# Altium project TIE_2025.PrjPcb
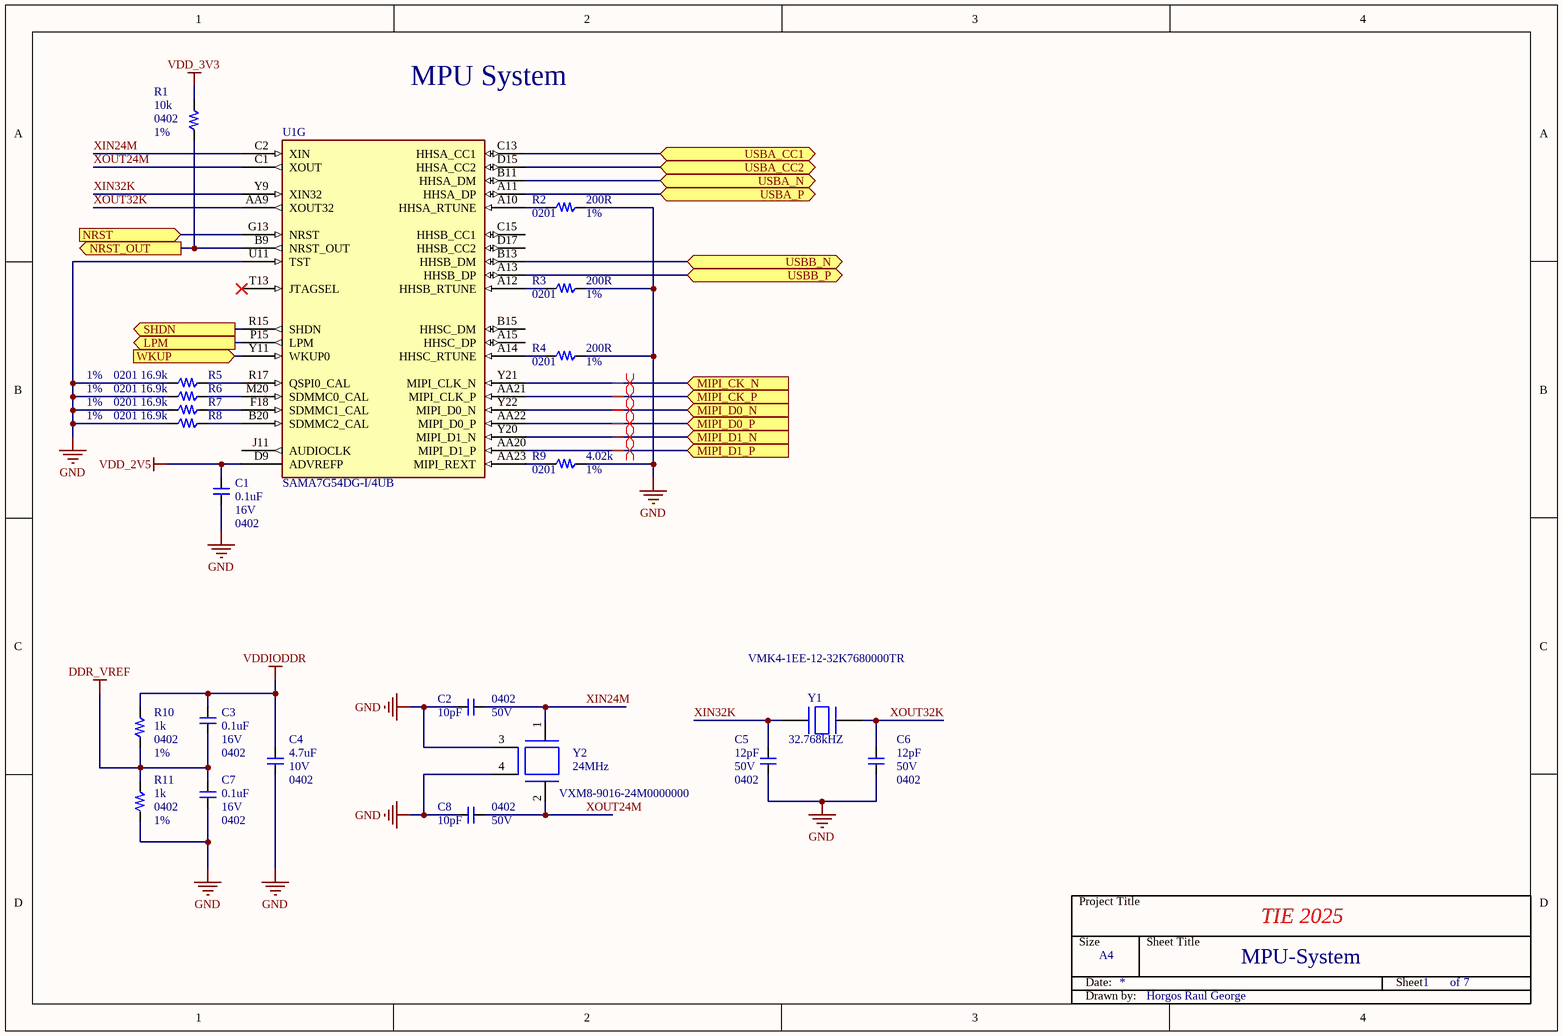
[diagram p0: MPU-System.SchDoc]
7 sheets, 139 parts. Net scope: flat (ports and power ports of the same name join across sheets).
Board file: PCB1.PcbDoc
Sheets:
  MPU-System.SchDoc
  MPU-Power.SchDoc
  MPU-PIO.SchDoc
  USB.SchDoc
  PMIC.SchDoc
  SDCard-MIPI-User.SchDoc
  Ethernet.SchDoc

## Sheet MPU-System.SchDoc
size A4; SheetNumber: 1; SheetTotal: 7

### Parts
C1  0.1uF  Rated Voltage: 16V  Package: 0402  [CAP0402]
C2  10pF  Rated Voltage: 50V  Package: 0402  [CAP0402]
C3  0.1uF  Rated Voltage: 16V  Package: 0402  [CAP0402]
C4  4.7uF  Package: 0402  Rated Voltage: 10V  [CAP0402]
C5  12pF  Rated Voltage: 50V  Package: 0402  [CAP0402]
C6  12pF  Rated Voltage: 50V  Package: 0402  [CAP0402]
C7  0.1uF  Rated Voltage: 16V  Package: 0402  [CAP0402]
C8  10pF  Rated Voltage: 50V  Package: 0402  [CAP0402]
R1  10k  Tolerance: 1%  Package: 0402  [RES0402]
R2  200R  Tolerance: 1%  Package: 0201  [RES0201]
R3  200R  Tolerance: 1%  Package: 0201  [RES0201]
R4  200R  Tolerance: 1%  Package: 0201  [RES0201]
R5  16.9k  Tolerance: 1%  Package: 0201  [RES0201]
R6  16.9k  Tolerance: 1%  Package: 0201  [RES0201]
R7  16.9k  Tolerance: 1%  Package: 0201  [RES0201]
R8  16.9k  Tolerance: 1%  Package: 0201  [RES0201]
R9  4.02k  Package: 0201  Tolerance: 1%  [RES0201]
R10  1k  Tolerance: 1%  Package: 0402  [RES0402]
R11  1k  Tolerance: 1%  Package: 0402  [RES0402]
Title_1  Title Block  (value not drawn)  (graphical)
U1  SAMA7G54DG-I/4UB  [BGA427C80P25X21_2100X1800X120]  (part G of 8)
Y1  32.768kHZ  [VMK4-1EE-12-32K7680000TR]
Y2  24MHz  [VXM8-9016-24M0000000]

### Ports
LPM (out, see PMIC[1A]), MIPI_CK_N (in, see SDCard-MIPI-User[1A]), MIPI_CK_P (in, see SDCard-MIPI-User[1B]), MIPI_D0_N (in, see SDCard-MIPI-User[1A]), MIPI_D0_P (in, see SDCard-MIPI-User[1A]), MIPI_D1_N (in, see SDCard-MIPI-User[1A]), MIPI_D1_P (in, see SDCard-MIPI-User[1A]), NRST (in, see PMIC[1B], SDCard-MIPI-User[2D]), NRST_OUT (out, see Ethernet[1D]), SHDN (out, see PMIC[1A]), USBA_CC1 (bidir, see USB[2A]), USBA_CC2 (bidir, see USB[2B]), USBA_N (bidir, see USB[2A]), USBA_P (bidir, see USB[2A]), USBB_N (bidir, see USB[2D]), USBB_P (bidir, see USB[2D]), WKUP (in, see PMIC[1B])

### Nets
DDR_VREF: C3.1 C7.2 R10.1 R11.2
GND: C1.1 C2.1 C4.1 C5.1 C6.1 C7.1 C8.1 R2.2 R3.2 R4.2 R5.1 R6.1 R7.1 R8.1 R9.2 R11.1 U1.U11(TST) Y2.3 Y2.4
VDD_2V5: C1.2 U1.D9(ADVREFP)
VDD_3V3: R1.2
VDDIODDR: C3.2 C4.2 R10.2
LPM: U1.P15(LPM) ; port LPM
MIPI_CK_N: U1.Y21(MIPI_CLK_N) ; port MIPI_CK_N
MIPI_CK_P: U1.AA21(MIPI_CLK_P) ; port MIPI_CK_P
MIPI_D0_N: U1.Y22(MIPI_D0_N) ; port MIPI_D0_N
MIPI_D0_P: U1.AA22(MIPI_D0_P) ; port MIPI_D0_P
MIPI_D1_N: U1.Y20(MIPI_D1_N) ; port MIPI_D1_N
MIPI_D1_P: U1.AA20(MIPI_D1_P) ; port MIPI_D1_P
NRST: U1.G13(NRST) ; port NRST
NRST_OUT: R1.1 U1.B9(NRST_OUT) ; port NRST_OUT
SHDN: U1.R15(SHDN) ; port SHDN
USBA_CC1: U1.C13(HHSA_CC1) ; port USBA_CC1
USBA_CC2: U1.D15(HHSA_CC2) ; port USBA_CC2
USBA_N: U1.B11(HHSA_DM) ; port USBA_N
USBA_P: U1.A11(HHSA_DP) ; port USBA_P
USBB_N: U1.B13(HHSB_DM) ; port USBB_N
USBB_P: U1.A13(HHSB_DP) ; port USBB_P
WKUP: U1.Y11(WKUP0) ; port WKUP
XIN24M: C2.2 U1.C2(XIN) Y2.1
XIN32K: C5.2 U1.Y9(XIN32) Y1.1
XOUT24M: C8.2 U1.C1(XOUT) Y2.2
XOUT32K: C6.2 U1.AA9(XOUT32) Y1.2
NetR2_1: R2.1 U1.A10(HHSA_RTUNE)
NetR3_1: R3.1 U1.A12(HHSB_RTUNE)
NetR4_1: R4.1 U1.A14(HHSC_RTUNE)
NetR5_2: R5.2 U1.R17(QSPI0_CAL)
NetR6_2: R6.2 U1.M20(SDMMC0_CAL)
NetR7_2: R7.2 U1.F18(SDMMC1_CAL)
NetR8_2: R8.2 U1.B20(SDMMC2_CAL)
NetR9_1: R9.1 U1.AA23(MIPI_REXT)

Not connected (* = marked no-connect by the designer): U1 A15(HHSC_DP) B15(HHSC_DM) C15(HHSB_CC1) D17(HHSB_CC2) J11(AUDIOCLK) T13(JTAGSEL)*

### Layout directives
differential pair: MIPI_CK_N, MIPI_CK_P, MIPI_D0_N, MIPI_D0_P, MIPI_D1_N, MIPI_D1_P

### Notes on the sheet
- MPU System
- MPU-System
- (in symbol Title Block) Project Title; TIE 2025; Size; Sheet Title; A4; Date:; Sheet; of; Drawn by:; Horgos Raul George

### Library data of the parts
C1 C3 C7 = C0402C104K4RAC7867: CAP CER 0.1uF 16V 10% X7R SMD 0402; Manufacturer: KEMET; .Checked_PCB: AI; Manufacturer Part Number: C0402C104K4RAC7867; .Checked_SCH: AI; .Creator: AI
C2 C8 = QSCF500Q100J1GV001T: CAP CER 10pF 50V 5% C0G/NP0 SMD 0402; Manufacturer: Johanson Technology; .Checked_PCB: AI; Manufacturer Part Number: QSCF500Q100J1GV001T; .Checked_SCH: AI; .Creator: AI
C4 = C1005X5R1A475K050BC: CAP CER 4.7uF 10V 10% X5R SMD 0402; Manufacturer: TDK Corporation; .Checked_PCB: AI; Manufacturer Part Number: C1005X5R1A475K050BC; .Checked_SCH: AI; .Creator: AI
C5 C6 = QSCF500Q120J1GV001T: CAP CER 12pF 50V 5% C0G/NP0 SMD 0402; Manufacturer: Johanson Technology; .Checked_PCB: AI; Manufacturer Part Number: QSCF500Q120J1GV001T; .Checked_SCH: AI; .Creator: AI
R1 = ERJ-2RKF1002X: RES TKF 10k 1% 1/10W SMD 0402; Manufacturer: Panasonic; Manufacturer Part Number: ERJ-2RKF1002X
R2-R4 = CR0201-FW-2000GLF: RES TKF 200R 1% 1/20W SMD 0201; Manufacturer: Bourns Inc.; Manufacturer Part Number: CR0201-FW-2000GLF
R5-R8 = ERJ-1GNF1692C: RES TKF 16.9k 1% 1/20W SMD 0201; Manufacturer: Panasonic Electronic; Manufacturer Part Number: ERJ-1GNF1692C
R9 = RC0201FR-074K02L: RES TKF 4.02k 1% 1/20W SMD 0201; Manufacturer: Yageo; Manufacturer Part Number: RC0201FR-074K02L
R10 R11 = ERJ-2RKF1001X: RES TKF 1k 1% 1/10W SMD 0402; Manufacturer: Panasonic; Manufacturer Part Number: ERJ-2RKF1001X
U1 = SAMA7G54DG-I/4UB: MCHP MPU SiP 32-BIT Cortex-A7 1000MHz 128kB 2Gbit / SAMA7G54D2G-I/4UB LFBGA-427; Manufacturer: Microchip Technology; Manufacturer Part Number: SAMA7G54DG-I/4UB
Y1 = VMK4-1EE-12-32K7680000TR: MCHP CRYSTAL 32.768kHz 12.5pF VMK4-1EE-12-32K7680000TR / SMD L2.0W1.2H0.5; Manufacturer: Microchip Technology; Manufacturer Part Number: VMK4-1EE-12-32K7680000TR
Y2 = VXM8-9016-24M0000000: MCHP CRYSTAL 24MHz 10pF VXM8-9016-24M000000 SMD / L2.5W2H0.55; Manufacturer: Microchip Technology; Manufacturer Part Number: VXM8-9016-24M0000000

## Sheet MPU-Power.SchDoc
size A4; SheetNumber: 2; SheetTotal: 7
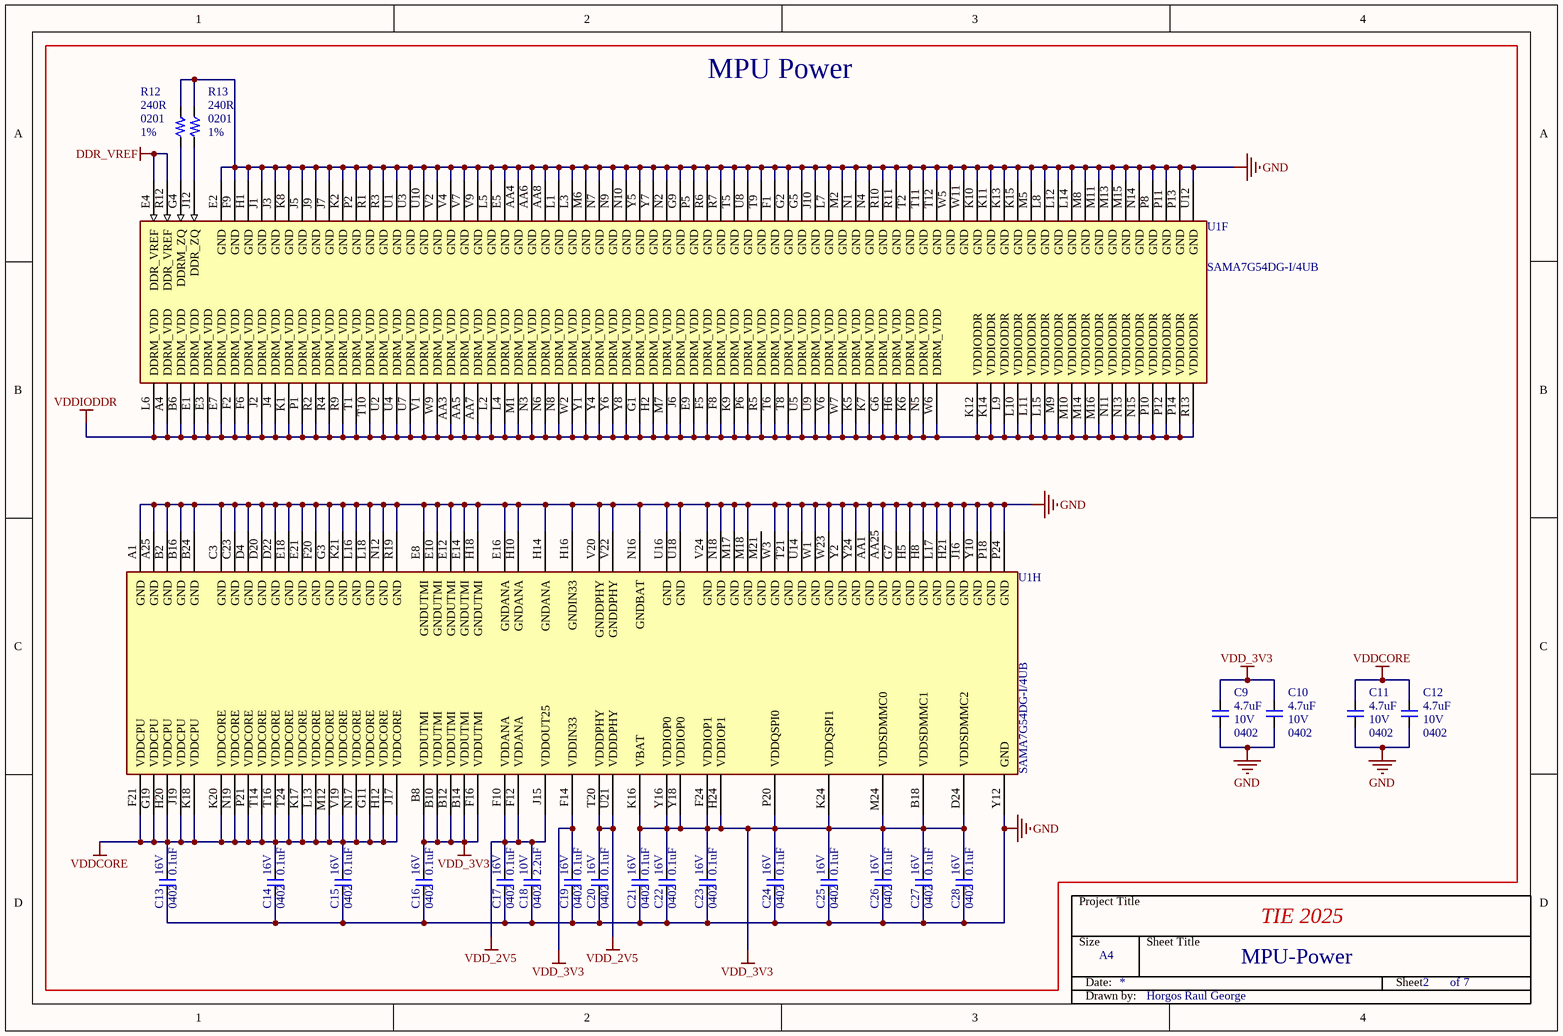
[diagram p1: MPU-Power.SchDoc]

### Parts
C9  4.7uF  Package: 0402  Rated Voltage: 10V  [CAP0402]
C10  4.7uF  Package: 0402  Rated Voltage: 10V  [CAP0402]
C11  4.7uF  Package: 0402  Rated Voltage: 10V  [CAP0402]
C12  4.7uF  Package: 0402  Rated Voltage: 10V  [CAP0402]
C13  0.1uF  Rated Voltage: 16V  Package: 0402  [CAP0402]
C14  0.1uF  Rated Voltage: 16V  Package: 0402  [CAP0402]
C15  0.1uF  Rated Voltage: 16V  Package: 0402  [CAP0402]
C16  0.1uF  Rated Voltage: 16V  Package: 0402  [CAP0402]
C17  0.1uF  Rated Voltage: 16V  Package: 0402  [CAP0402]
C18  2.2uF  Package: 0402  Rated Voltage: 10V  [CAP0402]
C19  0.1uF  Rated Voltage: 16V  Package: 0402  [CAP0402]
C20  0.1uF  Rated Voltage: 16V  Package: 0402  [CAP0402]
C21  0.1uF  Rated Voltage: 16V  Package: 0402  [CAP0402]
C22  0.1uF  Rated Voltage: 16V  Package: 0402  [CAP0402]
C23  0.1uF  Rated Voltage: 16V  Package: 0402  [CAP0402]
C24  0.1uF  Rated Voltage: 16V  Package: 0402  [CAP0402]
C25  0.1uF  Rated Voltage: 16V  Package: 0402  [CAP0402]
C26  0.1uF  Rated Voltage: 16V  Package: 0402  [CAP0402]
C27  0.1uF  Rated Voltage: 16V  Package: 0402  [CAP0402]
C28  0.1uF  Rated Voltage: 16V  Package: 0402  [CAP0402]
R12  240R  Package: 0201  Tolerance: 1%  [RES0201]
R13  240R  Package: 0201  Tolerance: 1%  [RES0201]
Title_2  Title Block  (value not drawn)  (graphical)
U1  SAMA7G54DG-I/4UB  [BGA427C80P25X21_2100X1800X120]  (parts F,H of 8)

### Nets
DDR_VREF: U1.E4(DDR_VREF) U1.R12(DDR_VREF)
GND: C9.1 C10.1 C11.1 C12.1 C13.1 C14.1 C15.1 C16.1 C17.1 C18.1 C19.1 C20.1 C21.1 C22.1 C23.1 C24.1 C25.1 C26.1 C27.1 C28.1 R12.2 R13.1 U1.A1(GND) U1.A25(GND) U1.AA1(GND) U1.AA4(GND) U1.AA6(GND) U1.AA8(GND) U1.AA25(GND) U1.B2(GND) U1.B16(GND) U1.B24(GND) U1.C3(GND) U1.C23(GND) U1.D4(GND) U1.D20(GND) U1.D22(GND) U1.E2(GND) U1.E5(GND) U1.E8(GNDUTMI) U1.E10(GNDUTMI) U1.E12(GNDUTMI) U1.E14(GNDUTMI) U1.E16(GNDANA) U1.E18(GND) U1.E21(GND) U1.F1(GND) U1.F9(GND) U1.F20(GND) U1.G2(GND) U1.G3(GND) U1.G5(GND) U1.G7(GND) U1.G9(GND) U1.H1(GND) U1.H5(GND) U1.H8(GND) U1.H10(GNDANA) U1.H14(GNDANA) U1.H16(GNDIN33) U1.H18(GNDUTMI) U1.H21(GND) U1.J1(GND) U1.J3(GND) U1.J5(GND) U1.J7(GND) U1.J9(GND) U1.J10(GND) U1.J16(GND) U1.K2(GND) U1.K8(GND) U1.K10(GND) U1.K11(GND) U1.K13(GND) U1.K15(GND) U1.K21(GND) U1.L1(GND) U1.L3(GND) U1.L5(GND) U1.L7(GND) U1.L8(GND) U1.L12(GND) U1.L14(GND) U1.L16(GND) U1.L17(GND) U1.L18(GND) U1.M2(GND) U1.M5(GND) U1.M6(GND) U1.M8(GND) U1.M11(GND) U1.M13(GND) U1.M15(GND) U1.M17(GND) U1.M18(GND) U1.N1(GND) U1.N2(GND) U1.N4(GND) U1.N7(GND) U1.N9(GND) U1.N10(GND) U1.N12(GND) U1.N14(GND) U1.N16(GNDBAT) U1.N18(GND) U1.P2(GND) U1.P5(GND) U1.P8(GND) U1.P11(GND) U1.P13(GND) U1.P18(GND) U1.P24(GND) U1.R1(GND) U1.R3(GND) U1.R6(GND) U1.R7(GND) U1.R10(GND) U1.R11(GND) U1.R19(GND) U1.T2(GND) U1.T5(GND) U1.T9(GND) U1.T11(GND) U1.T12(GND) U1.T21(GND) U1.U1(GND) U1.U3(GND) U1.U8(GND) U1.U10(GND) U1.U12(GND) U1.U14(GND) U1.U16(GND) U1.U18(GND) U1.V2(GND) U1.V4(GND) U1.V7(GND) U1.V9(GND) U1.V20(GNDDPHY) U1.V22(GNDDPHY) U1.V24(GND) U1.W1(GND) U1.W3(GND) U1.W5(GND) U1.W11(GND) U1.W23(GND) U1.Y2(GND) U1.Y5(GND) U1.Y7(GND) U1.Y10(GND) U1.Y12(GND) U1.Y24(GND)
VDD_2V5: C17.2 C18.2 C20.2 U1.F10(VDDANA) U1.F12(VDDANA) U1.J15(VDDOUT25) U1.T20(VDDDPHY) U1.U21(VDDDPHY)
VDD_3V3: C9.2 C10.2 C16.2 C19.2 C21.2 C22.2 C23.2 C24.2 C25.2 C26.2 C27.2 C28.2 U1.B8(VDDUTMI) U1.B10(VDDUTMI) U1.B12(VDDUTMI) U1.B14(VDDUTMI) U1.B18(VDDSDMMC1) U1.D24(VDDSDMMC2) U1.F14(VDDIN33) U1.F16(VDDUTMI) U1.F24(VDDIOP1) U1.H24(VDDIOP1) U1.K16(VBAT) U1.K24(VDDQSPI1) U1.M24(VDDSDMMC0) U1.P20(VDDQSPI0) U1.Y16(VDDIOP0) U1.Y18(VDDIOP0)
VDDCORE: C11.2 C12.2 C13.2 C14.2 C15.2 U1.F21(VDDCPU) U1.G11(VDDCORE) U1.G19(VDDCPU) U1.H12(VDDCORE) U1.H20(VDDCPU) U1.J17(VDDCORE) U1.J19(VDDCPU) U1.K17(VDDCORE) U1.K18(VDDCPU) U1.K20(VDDCORE) U1.L13(VDDCORE) U1.M12(VDDCORE) U1.N17(VDDCORE) U1.N19(VDDCORE) U1.P21(VDDCORE) U1.T14(VDDCORE) U1.T16(VDDCORE) U1.T24(VDDCORE) U1.V19(VDDCORE)
VDDIODDR: U1.A4(DDRM_VDD) U1.AA3(DDRM_VDD) U1.AA5(DDRM_VDD) U1.AA7(DDRM_VDD) U1.B6(DDRM_VDD) U1.E1(DDRM_VDD) U1.E3(DDRM_VDD) U1.E7(DDRM_VDD) U1.E9(DDRM_VDD) U1.F2(DDRM_VDD) U1.F5(DDRM_VDD) U1.F6(DDRM_VDD) U1.F8(DDRM_VDD) U1.G1(DDRM_VDD) U1.G6(DDRM_VDD) U1.H2(DDRM_VDD) U1.H6(DDRM_VDD) U1.J2(DDRM_VDD) U1.J4(DDRM_VDD) U1.J6(DDRM_VDD) U1.K1(DDRM_VDD) U1.K5(DDRM_VDD) U1.K6(DDRM_VDD) U1.K7(DDRM_VDD) U1.K9(DDRM_VDD) U1.K12(VDDIODDR) U1.K14(VDDIODDR) U1.L2(DDRM_VDD) U1.L4(DDRM_VDD) U1.L6(DDRM_VDD) U1.L9(VDDIODDR) U1.L10(VDDIODDR) U1.L11(VDDIODDR) U1.L15(VDDIODDR) U1.M1(DDRM_VDD) U1.M7(DDRM_VDD) U1.M9(VDDIODDR) U1.M10(VDDIODDR) U1.M14(VDDIODDR) U1.M16(VDDIODDR) U1.N3(DDRM_VDD) U1.N5(DDRM_VDD) U1.N6(DDRM_VDD) U1.N8(DDRM_VDD) U1.N11(VDDIODDR) U1.N13(VDDIODDR) U1.N15(VDDIODDR) U1.P1(DDRM_VDD) U1.P6(DDRM_VDD) U1.P10(VDDIODDR) U1.P12(VDDIODDR) U1.P14(VDDIODDR) U1.R2(DDRM_VDD) U1.R4(DDRM_VDD) U1.R5(DDRM_VDD) U1.R9(DDRM_VDD) U1.R13(VDDIODDR) U1.T1(DDRM_VDD) U1.T6(DDRM_VDD) U1.T8(DDRM_VDD) U1.T10(DDRM_VDD) U1.U2(DDRM_VDD) U1.U4(DDRM_VDD) U1.U5(DDRM_VDD) U1.U7(DDRM_VDD) U1.U9(DDRM_VDD) U1.V1(DDRM_VDD) U1.V6(DDRM_VDD) U1.W2(DDRM_VDD) U1.W6(DDRM_VDD) U1.W7(DDRM_VDD) U1.W9(DDRM_VDD) U1.Y1(DDRM_VDD) U1.Y4(DDRM_VDD) U1.Y6(DDRM_VDD) U1.Y8(DDRM_VDD)
NetR12_1: R12.1 U1.G4(DDRM_ZQ)
NetR13_2: R13.2 U1.J12(DDR_ZQ)

Not connected (* = marked no-connect by the designer): U1 M21(GND)

### Notes on the sheet
- MPU Power
- MPU-Power
- (in symbol Title Block) Project Title; TIE 2025; Size; Sheet Title; A4; Date:; Sheet; of; Drawn by:; Horgos Raul George

### Library data of the parts
C9-C12 = C1005X5R1A475K050BC: as C4 on sheet MPU-System; Manufacturer Part Number: C1005X5R1A475K050BC; .Checked_SCH: AI; .Creator: AI
C13-C17 C19-C28 = C0402C104K4RAC7867: as C1 on sheet MPU-System; Manufacturer Part Number: C0402C104K4RAC7867; .Checked_SCH: AI; .Creator: AI
C18 = GRM155C71A225KE11J: CAP CER 2.2uF 10V 10% X7S SMD 0402; Manufacturer: Murata; .Checked_PCB: AI; Manufacturer Part Number: GRM155C71A225KE11J; .Checked_SCH: AI; .Creator: AI
R12 R13 = RC0201FR-07240RL: RES TKF 240R 1% 1/20W SMD 0201; Manufacturer: Yageo; Manufacturer Part Number: RC0201FR-07240RL
U1 = SAMA7G54DG-I/4UB: as U1 on sheet MPU-System; Manufacturer Part Number: SAMA7G54DG-I/4UB

## Sheet MPU-PIO.SchDoc
size A4; SheetNumber: 3; SheetTotal: 7
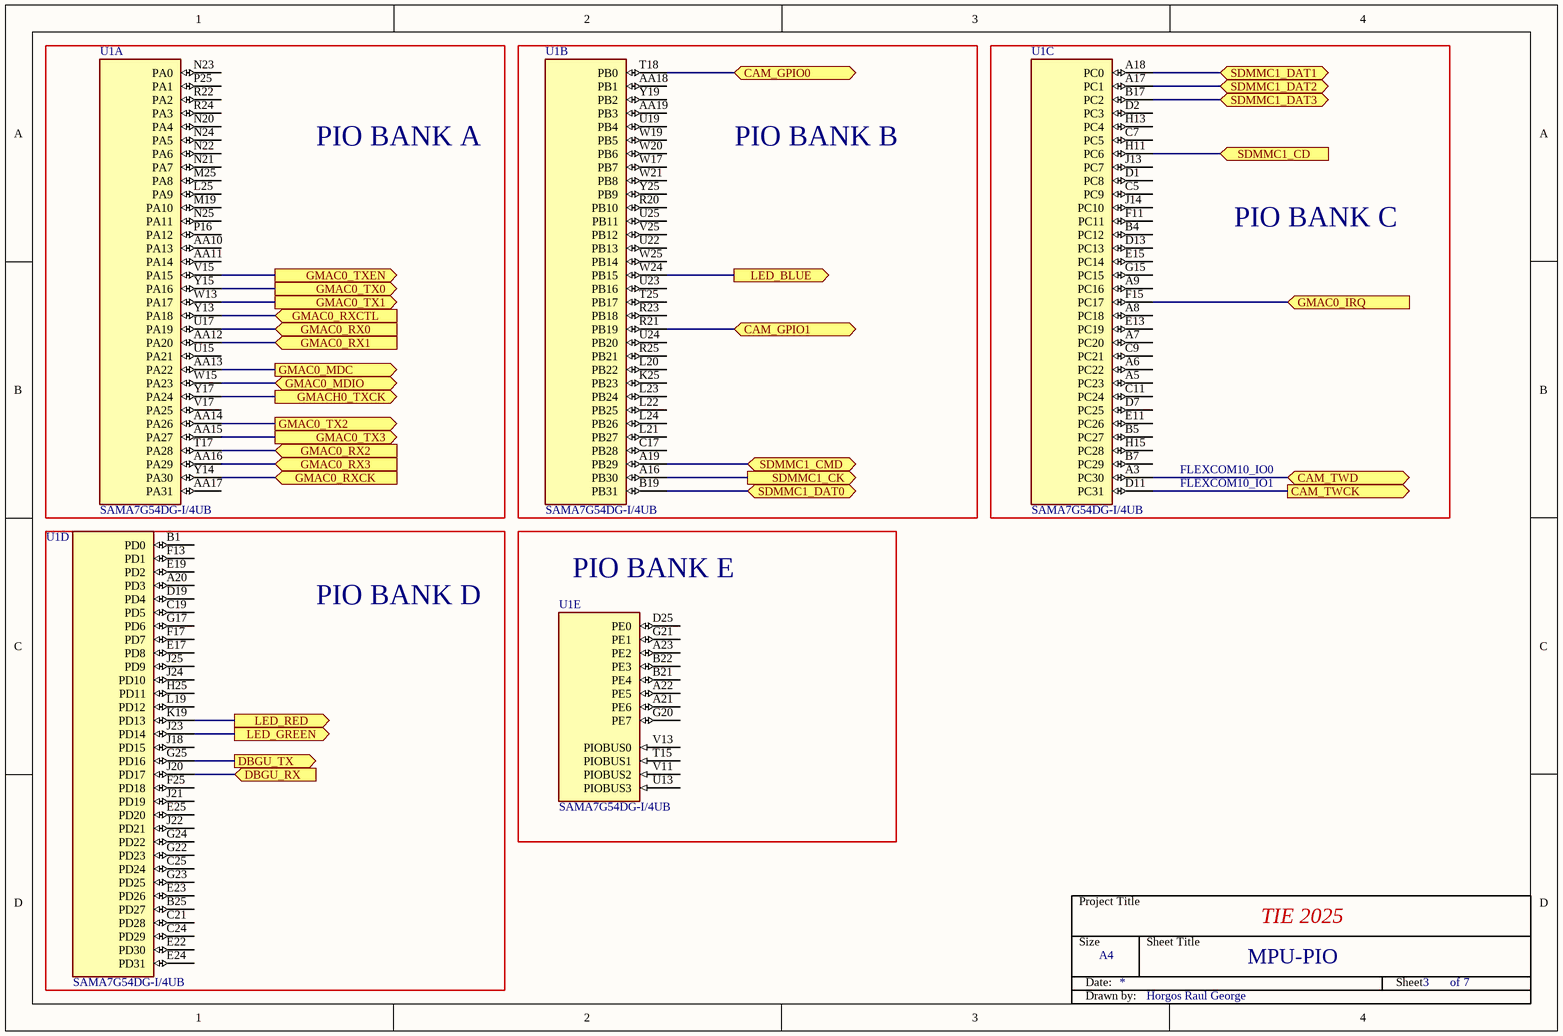
[diagram p2: MPU-PIO.SchDoc]

### Parts
Title_3  Title Block  (value not drawn)  (graphical)
U1  SAMA7G54DG-I/4UB  [BGA427C80P25X21_2100X1800X120]  (parts A,B,C,D,E of 8)

### Blocks framed on the sheet
PIO BANK A: U1
PIO BANK B: U1
PIO BANK C: U1
PIO BANK D: U1
PIO BANK E: U1

### Ports
CAM_GPIO0 (bidir, see SDCard-MIPI-User[1B]), CAM_GPIO1 (bidir, see SDCard-MIPI-User[1B]), CAM_TWCK (out, see SDCard-MIPI-User[1B]), CAM_TWD (bidir, see SDCard-MIPI-User[1B]), DBGU_RX (in, see SDCard-MIPI-User[2D]), DBGU_TX (out, see SDCard-MIPI-User[2D]), GMAC0_IRQ (in, see Ethernet[1C]), GMAC0_MDC (out, see Ethernet[1C]), GMAC0_MDIO (bidir, see Ethernet[1C]), GMAC0_RX0 (in, see Ethernet[1C]), GMAC0_RX1 (in, see Ethernet[1C]), GMAC0_RX2 (in, see Ethernet[1C]), GMAC0_RX3 (in, see Ethernet[1C]), GMAC0_RXCK (in, see Ethernet[1C]), GMAC0_RXCTL (in, see Ethernet[1C]), GMAC0_TX0 (out, see Ethernet[1C]), GMAC0_TX1 (out, see Ethernet[1C]), GMAC0_TX2 (out, see Ethernet[1C]), GMAC0_TX3 (out, see Ethernet[1C]), GMAC0_TXEN (out, see Ethernet[1C]), GMACH0_TXCK (out, see Ethernet[1C]), LED_BLUE (out, see SDCard-MIPI-User[1C]), LED_GREEN (out, see SDCard-MIPI-User[1C]), LED_RED (out, see SDCard-MIPI-User[1C]), SDMMC1_CD (in, see SDCard-MIPI-User[2B]), SDMMC1_CK (out, see SDCard-MIPI-User[2B]), SDMMC1_CMD (bidir, see SDCard-MIPI-User[2B]), SDMMC1_DAT0 (bidir, see SDCard-MIPI-User[2A]), SDMMC1_DAT1 (bidir, see SDCard-MIPI-User[2A]), SDMMC1_DAT2 (bidir, see SDCard-MIPI-User[2A]), SDMMC1_DAT3 (bidir, see SDCard-MIPI-User[2A])

### Nets
CAM_GPIO0: U1.T18(PB0) ; port CAM_GPIO0
CAM_GPIO1: U1.R21(PB19) ; port CAM_GPIO1
CAM_TWCK: U1.D11(PC31) ; port CAM_TWCK
CAM_TWD: U1.A3(PC30) ; port CAM_TWD
DBGU_RX: U1.J20(PD17) ; port DBGU_RX
DBGU_TX: U1.G25(PD16) ; port DBGU_TX
GMAC0_IRQ: U1.F15(PC17) ; port GMAC0_IRQ
GMAC0_MDC: U1.AA13(PA22) ; port GMAC0_MDC
GMAC0_MDIO: U1.W15(PA23) ; port GMAC0_MDIO
GMAC0_RX0: U1.U17(PA19) ; port GMAC0_RX0
GMAC0_RX1: U1.AA12(PA20) ; port GMAC0_RX1
GMAC0_RX2: U1.T17(PA28) ; port GMAC0_RX2
GMAC0_RX3: U1.AA16(PA29) ; port GMAC0_RX3
GMAC0_RXCK: U1.Y14(PA30) ; port GMAC0_RXCK
GMAC0_RXCTL: U1.Y13(PA18) ; port GMAC0_RXCTL
GMAC0_TX0: U1.Y15(PA16) ; port GMAC0_TX0
GMAC0_TX1: U1.W13(PA17) ; port GMAC0_TX1
GMAC0_TX2: U1.AA14(PA26) ; port GMAC0_TX2
GMAC0_TX3: U1.AA15(PA27) ; port GMAC0_TX3
GMAC0_TXEN: U1.V15(PA15) ; port GMAC0_TXEN
GMACH0_TXCK: U1.Y17(PA24) ; port GMACH0_TXCK
LED_BLUE: U1.W24(PB15) ; port LED_BLUE
LED_GREEN: U1.J23(PD14) ; port LED_GREEN
LED_RED: U1.K19(PD13) ; port LED_RED
SDMMC1_CD: U1.H11(PC6) ; port SDMMC1_CD
SDMMC1_CK: U1.A16(PB30) ; port SDMMC1_CK
SDMMC1_CMD: U1.A19(PB29) ; port SDMMC1_CMD
SDMMC1_DAT0: U1.B19(PB31) ; port SDMMC1_DAT0
SDMMC1_DAT1: U1.A18(PC0) ; port SDMMC1_DAT1
SDMMC1_DAT2: U1.A17(PC1) ; port SDMMC1_DAT2
SDMMC1_DAT3: U1.B17(PC2) ; port SDMMC1_DAT3

Not connected (* = marked no-connect by the designer): U1 A5(PC23) A6(PC22) A7(PC20) A8(PC18) A9(PC16) A20(PD3) A21(PE6) A22(PE5) A23(PE2) AA10(PA13) AA11(PA14) AA17(PA31) AA18(PB1) AA19(PB3) B1(PD0) B4(PC12) B5(PC27) B7(PC29) B21(PE4) B22(PE3) B25(PD27) C5(PC9) C7(PC5) C9(PC21) C11(PC24) C17(PB28) C19(PD5) C21(PD28) C24(PD29) C25(PD24) D1(PC8) D2(PC3) D7(PC25) D13(PC13) D19(PD4) D25(PE0) E11(PC26) E13(PC19) E15(PC14) E17(PD8) E19(PD2) E22(PD30) E23(PD26) E24(PD31) E25(PD20) F11(PC11) F13(PD1) F17(PD7) F25(PD18) G15(PC15) G17(PD6) G20(PE7) G21(PE1) G22(PD23) G23(PD25) G24(PD22) H13(PC4) H15(PC28) H25(PD11) J13(PC7) J14(PC10) J18(PD15) J21(PD19) J22(PD21) J24(PD10) J25(PD9) K25(PB23) L19(PD12) L20(PB22) L21(PB27) L22(PB25) L23(PB24) L24(PB26) L25(PA9) M19(PA10) M25(PA8) N20(PA4) N21(PA7) N22(PA6) N23(PA0) N24(PA5) N25(PA11) P16(PA12) P25(PA1) R20(PB10) R22(PA2) R23(PB18) R24(PA3) R25(PB21) T15(PIOBUS1) T25(PB17) U13(PIOBUS3) U15(PA21) U19(PB4) U22(PB13) U23(PB16) U24(PB20) U25(PB11) V11(PIOBUS2) V13(PIOBUS0) V17(PA25) V25(PB12) W17(PB7) W19(PB5) W20(PB6) W21(PB8) W25(PB14) Y19(PB2) Y25(PB9)

### Notes on the sheet
- FLEXCOM10_IO0
- FLEXCOM10_IO1
- MPU-PIO
- (in symbol Title Block) Project Title; TIE 2025; Size; Sheet Title; A4; Date:; Sheet; of; Drawn by:; Horgos Raul George

### Library data of the parts
U1 = SAMA7G54DG-I/4UB: as U1 on sheet MPU-System; Manufacturer Part Number: SAMA7G54DG-I/4UB

## Sheet USB.SchDoc
size A4; SheetNumber: 4; SheetTotal: 7
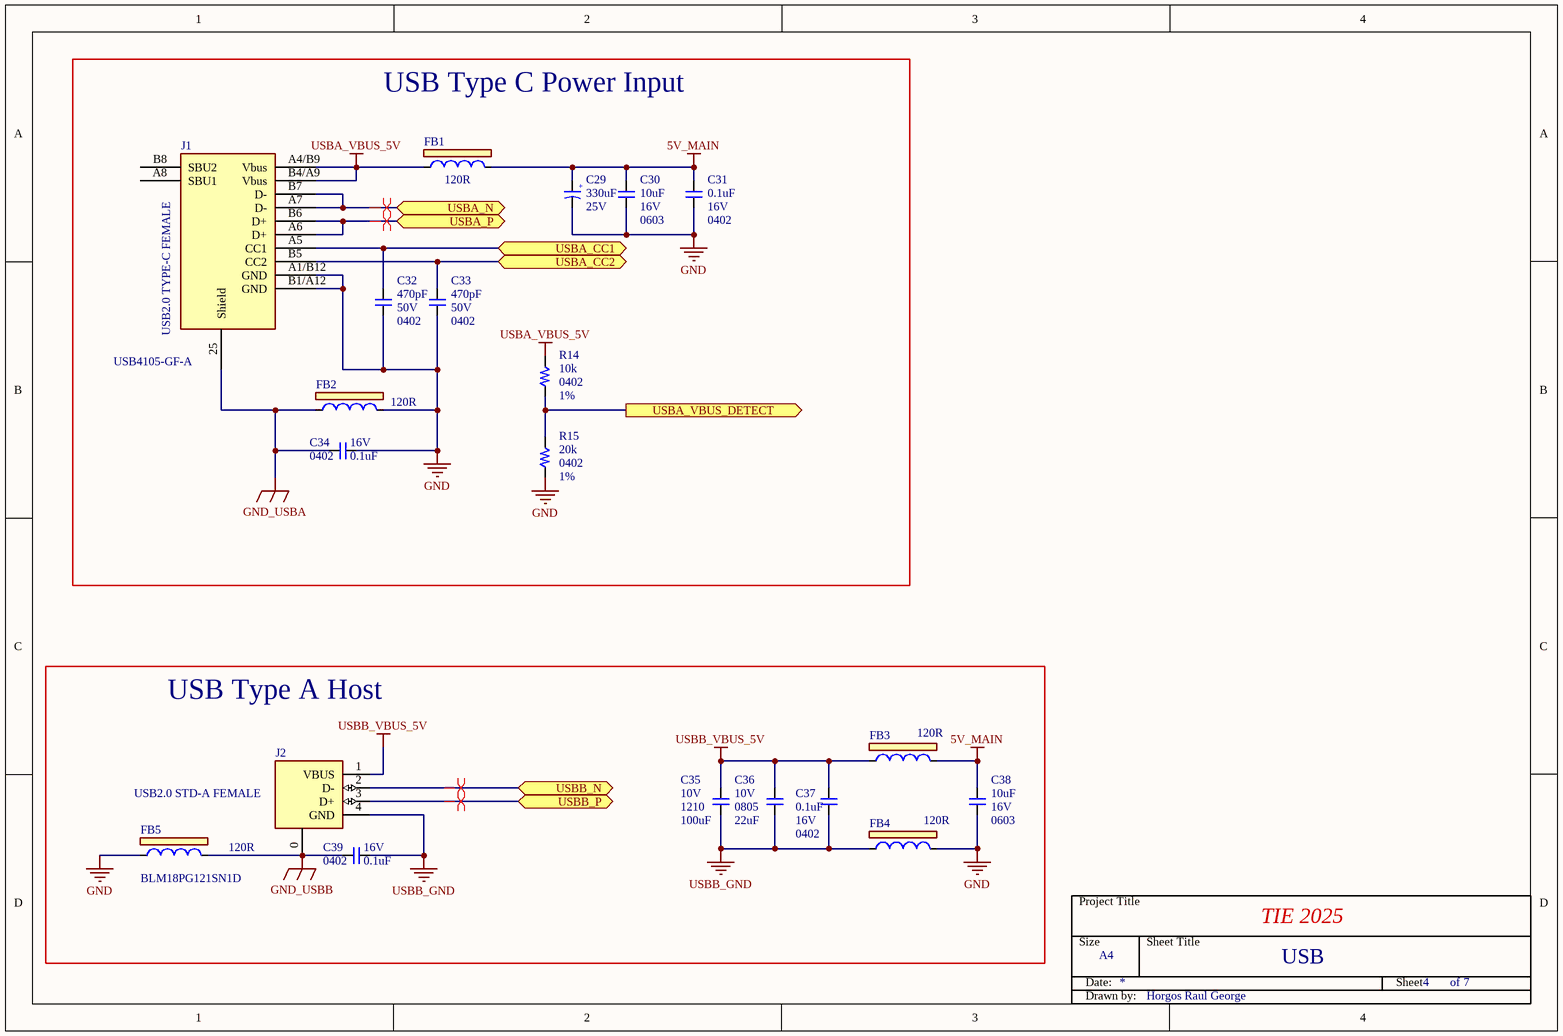
[diagram p3: USB.SchDoc]

### Parts
C29  330uF  Rated Voltage: 25V  [CAP ALU]
C30  10uF  Rated Voltage: 16V  Pacakage: 0603  [CAP0603]
C31  0.1uF  Rated Voltage: 16V  Package: 0402  [CAP0402]
C32  470pF  Rated Voltage: 50V  Package: 0402  [CAP0402]
C33  470pF  Rated Voltage: 50V  Package: 0402  [CAP0402]
C34  0.1uF  Rated Voltage: 16V  Package: 0402  [CAP0402]
C35  100uF  Rated Voltage: 10V  Package: 1210  [CAP1210]
C36  22uF  Rated Voltage: 10V  Package: 0805  [CAP0805]
C37  0.1uF  Rated Voltage: 16V  Package: 0402  [CAP0402]
C38  10uF  Rated Voltage: 16V  Pacakage: 0603  [CAP0603]
C39  0.1uF  Rated Voltage: 16V  Package: 0402  [CAP0402]
FB1  120R  [FB0603]
FB2  120R  [FB0603]
FB3  120R  [FB0603]
FB4  120R  [FB0603]
FB5  120R  [FB0603]
J1  USB2.0 TYPE-C FEMALE  [USB4105-GF-A]
J2  USB2.0 STD-A FEMALE  [292303-1]
R14  10k  Tolerance: 1%  Package: 0402  [RES0402]
R15  20k  Tolerance: 1%  Package: 0402  [RES0402]
Title_4  Title Block  (value not drawn)  (graphical)

### Blocks framed on the sheet
USB Type C Power Input: C29-C34 FB1 FB2 J1 R14 R15
USB Type A Host: C35-C39 FB3-FB5 J2

### Ports
USBA_CC1 (bidir, see MPU-System[2A]), USBA_CC2 (bidir, see MPU-System[2A]), USBA_N (bidir, see MPU-System[2A]), USBA_P (bidir, see MPU-System[2A]), USBA_VBUS_DETECT (out), USBB_N (bidir, see MPU-System[2B]), USBB_P (bidir, see MPU-System[2B])

### Nets
5V_MAIN: C29.1 C30.2 C31.2 C38.2 FB1.2 FB3.2
GND: C29.2 C30.1 C31.1 C32.1 C33.1 C34.1 C38.1 FB2.2 FB4.2 FB5.1 J1.A1/B12(GND) J1.B1/A12(GND) R15.1
GND_USBA: C34.2 FB2.1 J1.25(Shield)
GND_USBB: C39.2 FB5.2 J2.0
USBA_VBUS_5V: FB1.1 J1.A4/B9(Vbus) J1.B4/A9(Vbus) R14.2
USBB_GND: C35.1 C36.1 C37.1 C39.1 FB4.1 J2.4(GND)
USBB_VBUS_5V: C35.2 C36.2 C37.2 FB3.1 J2.1(VBUS)
USBA_CC1: C32.2 J1.A5(CC1) ; port USBA_CC1
USBA_CC2: C33.2 J1.B5(CC2) ; port USBA_CC2
USBA_N: J1.A7(D-) J1.B7(D-) ; port USBA_N
USBA_P: J1.A6(D+) J1.B6(D+) ; port USBA_P
USBA_VBUS_DETECT: R14.1 R15.2 ; port USBA_VBUS_DETECT
USBB_N: J2.2(D-) ; port USBB_N
USBB_P: J2.3(D+) ; port USBB_P

Not connected (* = marked no-connect by the designer): J1 A8(SBU1) B8(SBU2)

### Layout directives
differential pair: USBA_N, USBA_P, USBB_N, USBB_P

### Notes on the sheet
- USB
- (in symbol Title Block) Project Title; TIE 2025; Size; Sheet Title; A4; Date:; Sheet; of; Drawn by:; Horgos Raul George
- (in symbol UWT1E331MNL1GS) +

### Library data of the parts
C29 = UWT1E331MNL1GS: CAP ALU 330uF 25V 20% SMD F; Manufacturer: Nichicon; Manufacturer Part Number: UWT1E331MNL1GS
C30 C38 = GRT188R61C106KE13D: CAP CER 10uF 16V 10% X5R SMD 0603 AEC-Q200; Manufacturer: Murata; .Checked_PCB: IC; Manufacturer Part Number: GRT188R61C106KE13D; .Checked_SCH: IC; .Creator: IC
C31 C34 C37 C39 = C0402C104K4RAC7867: as C1 on sheet MPU-System; Manufacturer Part Number: C0402C104K4RAC7867; .Checked_SCH: AI; .Creator: AI
C32 C33 = GRM1555C1H471JA01D: CAP CER 470pF 50V 5% NP0 SMD 0402; Manufacturer: Murata; .Checked_PCB: AI; Manufacturer Part Number: GRM1555C1H471JA01D; .Checked_SCH: AI; .Creator: AI
C35 = GRM32ER61A107ME20L: CAP CER 100uF 10V 20% X5R SMD 1210; Manufacturer: Murata Electronics North; .Checked_PCB: IC; Manufacturer Part Number: GRM32ER61A107ME20L; .Checked_SCH: IC
C36 = C2012X7S1A226M125AC: CAP CER 22uF 10V 20% X7S SMD 0805; Manufacturer: TDK Corporation; Manufacturer Part Number: C2012X7S1A226M125AC
FB1-FB5 = BLM18PG121SN1D: FERRITE BEAD 120 OHM 0603 1LN; Manufacturer: Murata; .Checked_PCB: AI; .Checked_SCH: AI; .Creator: AI
  FB5: Manufacturer Part Number: BLM18PG121SN1D
J1 = USB4105-GF-A: CONN USB2.0 TYPE-C Female SMD/TH R/A; Manufacturer: GCT; Manufacturer Part Number: USB4105-GF-A
J2 = 292303-1: CON USB2.0 STD-A FEMALE TH R/A; Manufacturer: TE Connectivity AMP; Manufacturer Part Number: 292303-1
R14 = ERJ-2RKF1002X: as R1 on sheet MPU-System; Manufacturer Part Number: ERJ-2RKF1002X
R15 = RMCF0402FT20K0: RES TKF 20k 1% 1/10W SMD 0402; Manufacturer: Stackpole Electronics Inc; Manufacturer Part Number: RMCF0402FT20K0

## Sheet PMIC.SchDoc
size A4; SheetNumber: 5; SheetTotal: 7
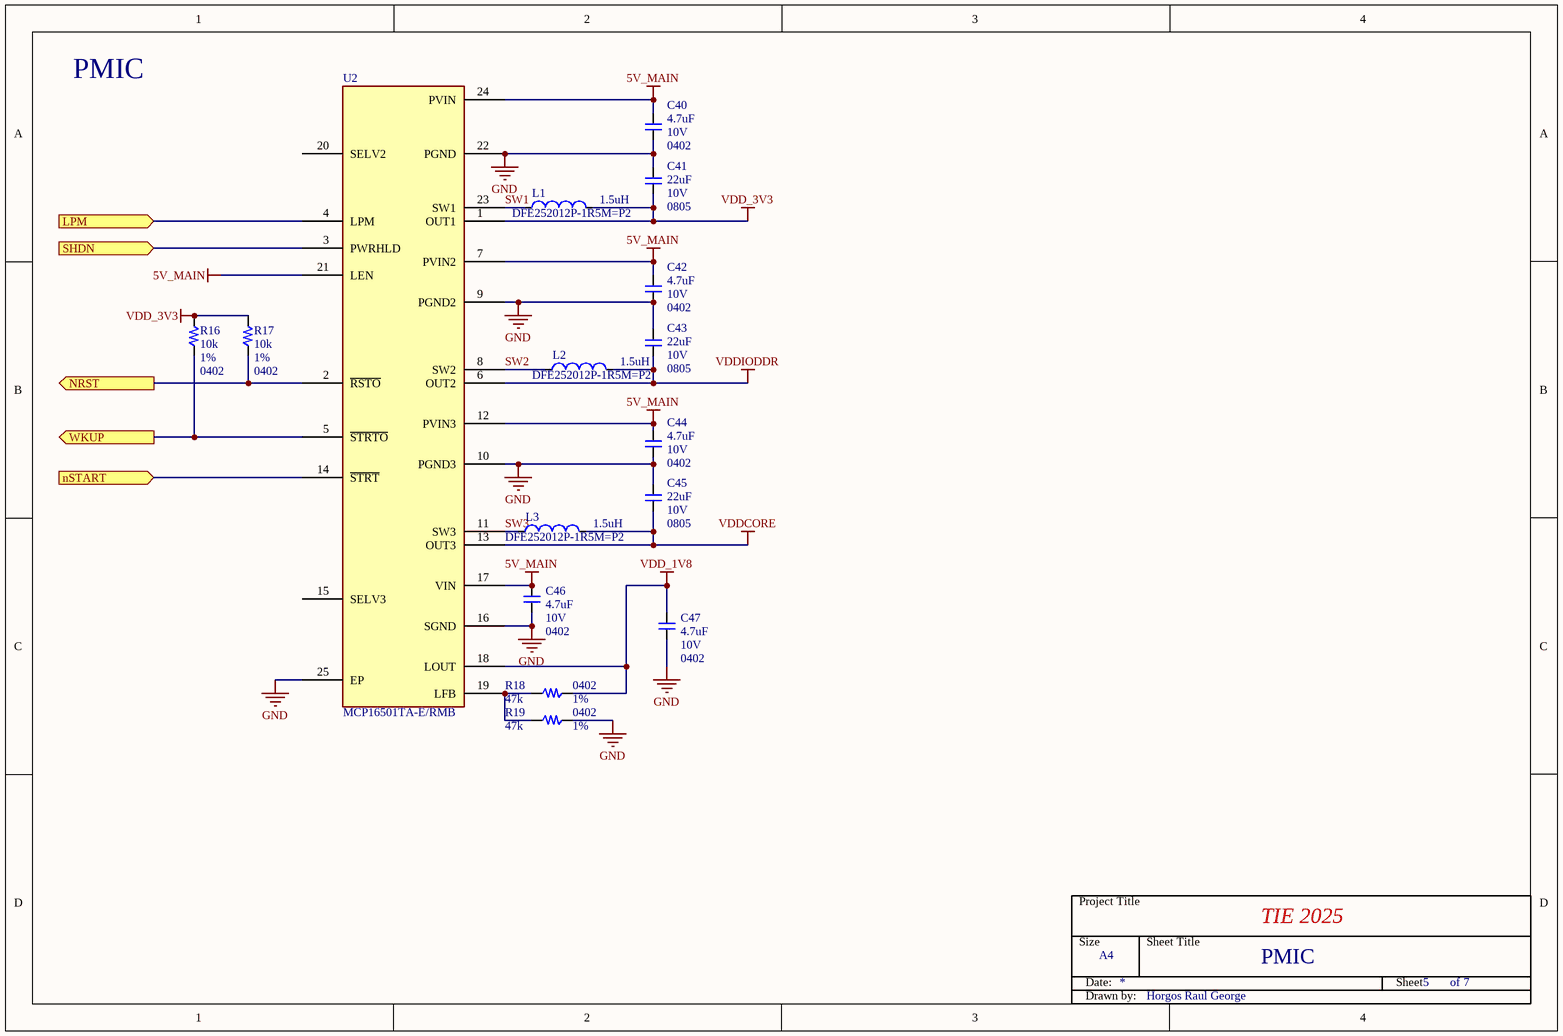
[diagram p4: PMIC.SchDoc]

### Parts
C40  4.7uF  Package: 0402  Rated Voltage: 10V  [CAP0402]
C41  22uF  Rated Voltage: 10V  Package: 0805  [CAP0805]
C42  4.7uF  Package: 0402  Rated Voltage: 10V  [CAP0402]
C43  22uF  Rated Voltage: 10V  Package: 0805  [CAP0805]
C44  4.7uF  Package: 0402  Rated Voltage: 10V  [CAP0402]
C45  22uF  Rated Voltage: 10V  Package: 0805  [CAP0805]
C46  4.7uF  Package: 0402  Rated Voltage: 10V  [CAP0402]
C47  4.7uF  Package: 0402  Rated Voltage: 10V  [CAP0402]
L1  1.5uH  [INDUCTOR1008]
L2  1.5uH  [INDUCTOR1008]
L3  1.5uH  [INDUCTOR1008]
R16  10k  Tolerance: 1%  Package: 0402  [RES0402]
R17  10k  Tolerance: 1%  Package: 0402  [RES0402]
R18  47k  Tolerance: 1%  Package: 0402  [RES0402]
R19  47k  Tolerance: 1%  Package: 0402  [RES0402]
Title_5  Title Block  (value not drawn)  (graphical)
U2  MCP16501TA-E/RMB  [QFN-24]

### Ports
LPM (in, see MPU-System[1B]), NRST (out, see MPU-System[1A], SDCard-MIPI-User[2D]), nSTART (in, see SDCard-MIPI-User[1D]), SHDN (in, see MPU-System[1B]), WKUP (out, see MPU-System[1B])

### Nets
5V_MAIN: C40.2 C42.2 C44.2 C46.2 U2.7(PVIN2) U2.12(PVIN3) U2.17(VIN) U2.21(LEN) U2.24(PVIN)
GND: C40.1 C41.2 C42.1 C43.2 C44.1 C45.2 C46.1 C47.1 R19.2 U2.9(PGND2) U2.10(PGND3) U2.16(SGND) U2.22(PGND) U2.25(EP)
VDD_1V8: C47.2 R18.2 U2.18(LOUT)
VDD_3V3: C41.1 L1.2 R16.2 R17.2 U2.1(OUT1)
VDDCORE: C45.1 L3.2 U2.13(OUT3)
VDDIODDR: C43.1 L2.2 U2.6(OUT2)
LPM: U2.4(LPM) ; port LPM
NRST: R17.1 U2.2(~{RSTO}) ; port NRST
nSTART: U2.14(~{STRT}) ; port nSTART
SHDN: U2.3(PWRHLD) ; port SHDN
SW1: L1.1 U2.23(SW1)
SW2: L2.1 U2.8(SW2)
SW3: L3.1 U2.11(SW3)
WKUP: R16.1 U2.5(~{STRTO}) ; port WKUP
NetR18_1: R18.1 R19.1 U2.19(LFB)

Not connected (* = marked no-connect by the designer): U2 15(SELV3) 20(SELV2)

### Notes on the sheet
- PMIC
- (in symbol Title Block) Project Title; TIE 2025; Size; Sheet Title; A4; Date:; Sheet; of; Drawn by:; Horgos Raul George

### Library data of the parts
C40 C42 C44 C46 C47 = C1005X5R1A475K050BC: as C4 on sheet MPU-System; Manufacturer Part Number: C1005X5R1A475K050BC; .Checked_SCH: AI; .Creator: AI
C41 C43 C45 = C2012X7S1A226M125AC: as C36 on sheet USB; Manufacturer Part Number: C2012X7S1A226M125AC
L1-L3 = DFE252012P-1R5M=P2: INDUCTOR 1.5uH 3.5A 20% SMD 1008; Manufacturer: Murata Electronics North; .Checked_PCB: AI; .Checked_SCH: AI; .Creator: AI; Parameter 1: *; Manufacturer Part Number: DFE252012P-1R5M=P2
R16 R17 = ERJ-2RKF1002X: as R1 on sheet MPU-System; Manufacturer Part Number: ERJ-2RKF1002X
R18 R19 = ERJ-2RKF4702X: RES TKF 47k 1% 1/10W SMD 0402 AEC-Q200; Manufacturer: Panasonic - ECG; Manufacturer Part Number: ERJ-2RKF4702X
U2 = MCP16501TA-E/RMB: MCHP ANALOG PMIC SWITCHER Buck ADJ MCP16501TA-E/RMB / QFN-24; Manufacturer: Microchip Technology; Manufacturer Part Number: MCP16501TA-E/RMB

## Sheet SDCard-MIPI-User.SchDoc
size A4; SheetNumber: 6; SheetTotal: 7
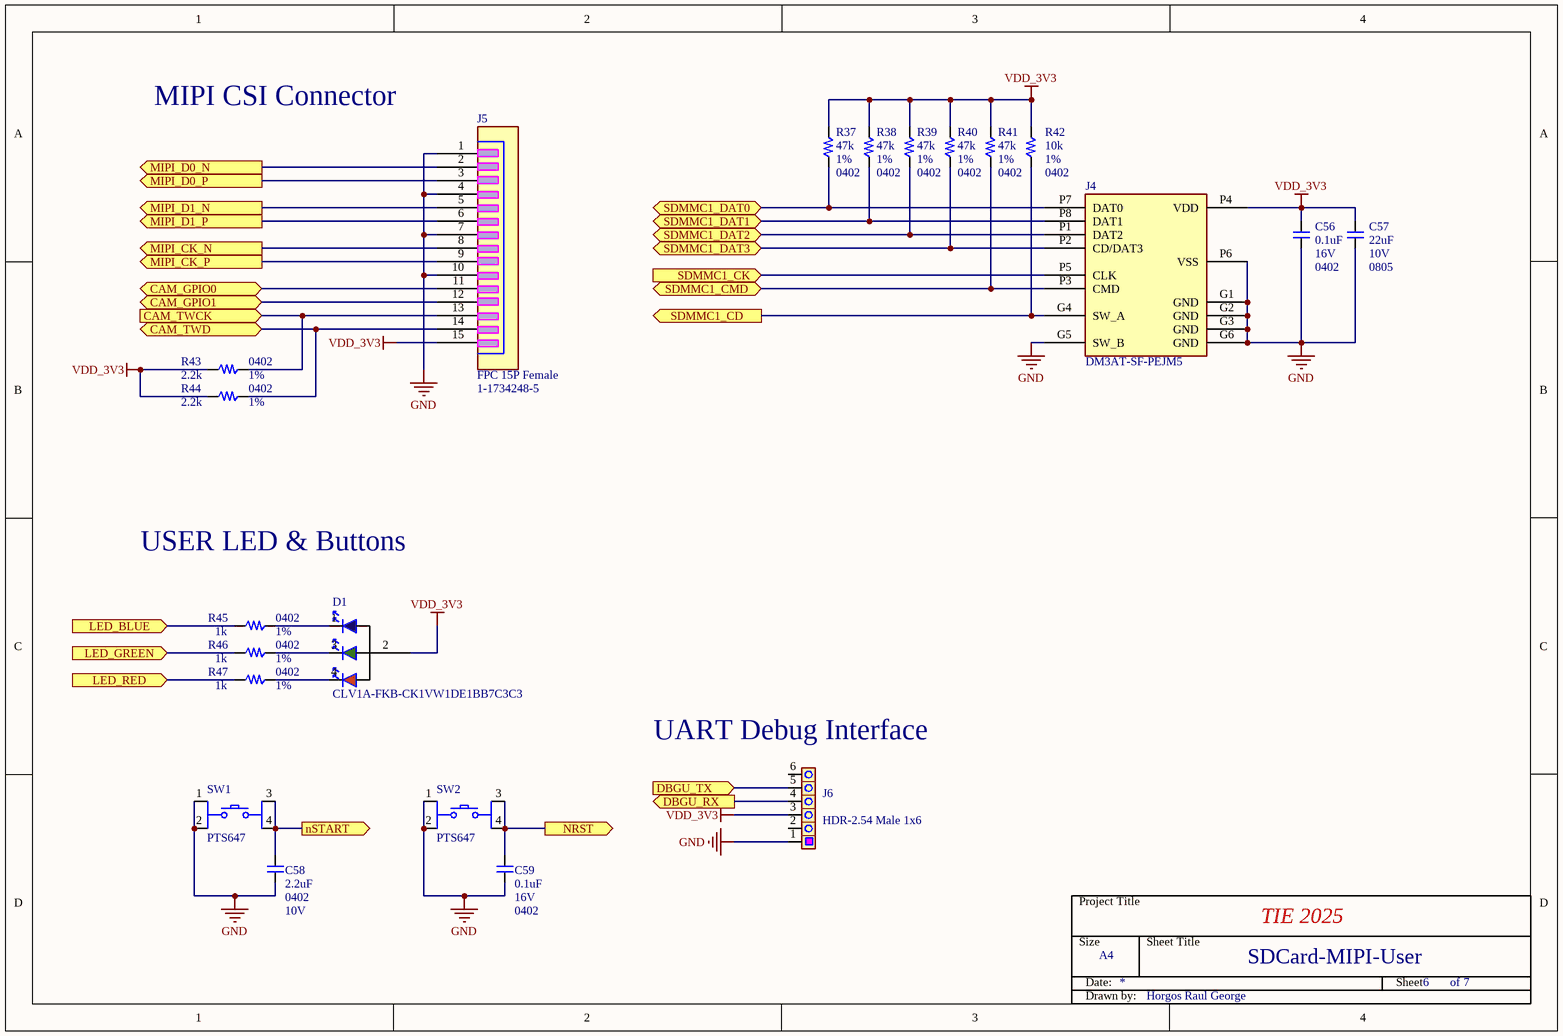
[diagram p5: SDCard-MIPI-User.SchDoc]

### Parts
C56  0.1uF  Rated Voltage: 16V  Package: 0402  [CAP0402]
C57  22uF  Rated Voltage: 10V  Package: 0805  [CAP0805]
C58  2.2uF  Package: 0402  Rated Voltage: 10V  [CAP0402]
C59  0.1uF  Rated Voltage: 16V  Package: 0402  [CAP0402]
D1  APT1608SRCPRV  [CLV1A-FKB-CK1VW1DE1BB7C3C3]  (value not drawn)
J4  DM3AT-SF-PEJM5  [DM3AT-SF-PEJM5]
J5  FPC 15P Female  [1-1734248-5_1]
J6  HDR-2.54 Male 1x6  [68001-106HLF]
R37  47k  Tolerance: 1%  Package: 0402  [RES0402]
R38  47k  Tolerance: 1%  Package: 0402  [RES0402]
R39  47k  Tolerance: 1%  Package: 0402  [RES0402]
R40  47k  Tolerance: 1%  Package: 0402  [RES0402]
R41  47k  Tolerance: 1%  Package: 0402  [RES0402]
R42  10k  Tolerance: 1%  Package: 0402  [RES0402]
R43  2.2k  Tolerance: 1%  Package: 0402  [RES0402]
R44  2.2k  Tolerance: 1%  Package: 0402  [RES0402]
R45  1k  Tolerance: 1%  Package: 0402  [RES0402]
R46  1k  Tolerance: 1%  Package: 0402  [RES0402]
R47  1k  Tolerance: 1%  Package: 0402  [RES0402]
SW1  PTS647  [PTS 647 SK38 SMTR2 LFS]
SW2  PTS647  [PTS 647 SK38 SMTR2 LFS]
Title_6  Title Block  (value not drawn)  (graphical)

### Ports
CAM_GPIO0 (bidir, see MPU-PIO[2A]), CAM_GPIO1 (bidir, see MPU-PIO[2B]), CAM_TWCK (in, see MPU-PIO[4B]), CAM_TWD (bidir, see MPU-PIO[4B]), DBGU_RX (out, see MPU-PIO[1D]), DBGU_TX (in, see MPU-PIO[1C]), LED_BLUE (in, see MPU-PIO[2B]), LED_GREEN (in, see MPU-PIO[1C]), LED_RED (in, see MPU-PIO[1C]), MIPI_CK_N (out, see MPU-System[2B]), MIPI_CK_P (out, see MPU-System[2B]), MIPI_D0_N (out, see MPU-System[2B]), MIPI_D0_P (out, see MPU-System[2B]), MIPI_D1_N (out, see MPU-System[2B]), MIPI_D1_P (out, see MPU-System[2B]), NRST (out, see MPU-System[1A], PMIC[1B]), nSTART (out, see PMIC[1B]), SDMMC1_CD (out, see MPU-PIO[4A]), SDMMC1_CK (in, see MPU-PIO[2B]), SDMMC1_CMD (bidir, see MPU-PIO[2B]), SDMMC1_DAT0 (bidir, see MPU-PIO[2B]), SDMMC1_DAT1 (bidir, see MPU-PIO[4A]), SDMMC1_DAT2 (bidir, see MPU-PIO[4A]), SDMMC1_DAT3 (bidir, see MPU-PIO[4A])

### Nets
GND: C56.1 C57.1 C58.1 C59.1 J4.G1(GND) J4.G2(GND) J4.G3(GND) J4.G5(SW_B) J4.G6(GND) J4.P6(VSS) J5.1 J5.4 J5.7 J5.10 J6.1 SW1.1 SW1.2 SW2.1 SW2.2
VDD_3V3: C56.2 C57.2 D1.2 J4.P4(VDD) J5.15 J6.3 R37.2 R38.2 R39.2 R40.2 R41.2 R42.2 R43.1 R44.1
CAM_GPIO0: J5.11 ; port CAM_GPIO0
CAM_GPIO1: J5.12 ; port CAM_GPIO1
CAM_TWCK: J5.13 R43.2 ; port CAM_TWCK
CAM_TWD: J5.14 R44.2 ; port CAM_TWD
DBGU_RX: J6.4 ; port DBGU_RX
DBGU_TX: J6.5 ; port DBGU_TX
LED_BLUE: R45.1 ; port LED_BLUE
LED_GREEN: R46.1 ; port LED_GREEN
LED_RED: R47.1 ; port LED_RED
MIPI_CK_N: J5.8 ; port MIPI_CK_N
MIPI_CK_P: J5.9 ; port MIPI_CK_P
MIPI_D0_N: J5.2 ; port MIPI_D0_N
MIPI_D0_P: J5.3 ; port MIPI_D0_P
MIPI_D1_N: J5.5 ; port MIPI_D1_N
MIPI_D1_P: J5.6 ; port MIPI_D1_P
NRST: C59.2 SW2.3 SW2.4 ; port NRST
nSTART: C58.2 SW1.3 SW1.4 ; port nSTART
SDMMC1_CD: J4.G4(SW_A) R42.1 ; port SDMMC1_CD
SDMMC1_CK: J4.P5(CLK) ; port SDMMC1_CK
SDMMC1_CMD: J4.P3(CMD) R41.1 ; port SDMMC1_CMD
SDMMC1_DAT0: J4.P7(DAT0) R37.1 ; port SDMMC1_DAT0
SDMMC1_DAT1: J4.P8(DAT1) R38.1 ; port SDMMC1_DAT1
SDMMC1_DAT2: J4.P1(DAT2) R39.1 ; port SDMMC1_DAT2
SDMMC1_DAT3: J4.P2(CD/DAT3) R40.1 ; port SDMMC1_DAT3
NetD1_1: D1.1 R45.2
NetD1_3: D1.3 R46.2
NetD1_4: D1.4 R47.2

Not connected (* = marked no-connect by the designer): J6 2 6

### Notes on the sheet
- MIPI CSI Connector
- USER LED & Buttons
- (near J6) UART Debug Interface
- SDCard-MIPI-User
- (in symbol Title Block) Project Title; TIE 2025; Size; Sheet Title; A4; Date:; Sheet; of; Drawn by:; Horgos Raul George

### Library data of the parts
C56 C59 = C0402C104K4RAC7867: as C1 on sheet MPU-System; Manufacturer Part Number: C0402C104K4RAC7867; .Checked_SCH: AI; .Creator: AI
C57 = C2012X7S1A226M125AC: as C36 on sheet USB; Manufacturer Part Number: C2012X7S1A226M125AC
C58 = GRM155C71A225KE11J: as C18 on sheet MPU-Power; Manufacturer Part Number: GRM155C71A225KE11J; .Checked_SCH: AI; .Creator: AI
D1 = CLV1A-FKB-CK1VW1DE1BB7C3C3: DIO LED TRI RED, GREEN, BLUE 2V, 3.2V, 3.2V 20mA, 20mA, / 20mA SMD 4-PLCC; Manufacturer: Cree Inc.; .Checked_PCB: IC; .Checked_SCH: IC; Manufacturer Part Number: CLV1A-FKB-CK1VW1DE1BB7C3C3
J4 = DM3AT-SF-PEJM5: CON FLASH microSD 8+2P Push-Push SMD; Manufacturer: Hirose Electric Co Ltd; Manufacturer Part Number: DM3AT-SF-PEJM5
J5 = 1-1734248-5: CON FPC 1mm 15P Female SMD VERT; Manufacturer: TE Connectivity AMP; Manufacturer Part Number: 1-1734248-5
J6 = 68001-106HLF: CON HDR-2.54 Male 1x6 Gold 5.84MH TH VERT; Manufacturer: FCI; Manufacturer Part Number: 68001-106HLF
R37-R41 = ERJ-2RKF4702X: as R18 on sheet PMIC; Manufacturer Part Number: ERJ-2RKF4702X
R42 = ERJ-2RKF1002X: as R1 on sheet MPU-System; Manufacturer Part Number: ERJ-2RKF1002X
R43 R44 = ERJ-2RKF2201X: RES TKF 2.2k 1% 1/10W SMD 0402; Manufacturer: Panasonic; Manufacturer Part Number: ERJ-2RKF2201X
R45-R47 = ERJ-2RKF1001X: as R10 on sheet MPU-System; Manufacturer Part Number: ERJ-2RKF1001X
SW1 SW2 = PTS647: SWITCH TACT SPST 12V 50mA PTS 647 SK38 SMTR2 LFSSMD; Manufacturer: C&K; Datasheet Link: https://datasheet.datasheetarchive.com/originals/distributors/Datasheets_SAMA/dda6c2a9a64375c9ffe9508ecade46cd.pdf; Height: 3.8mm; Arrow Part Number: PTS 647 SK38 SMTR2 LFS; Arrow Price/Stock: https://www.arrow.com/en/products/pts-647-sk38-smtr2-lfs/ck?region=europe; Manufacturer Part Number: PTS 647 SK38 SMTR2 LFS

## Sheet Ethernet.SchDoc
size A4; SheetNumber: 7; SheetTotal: 7
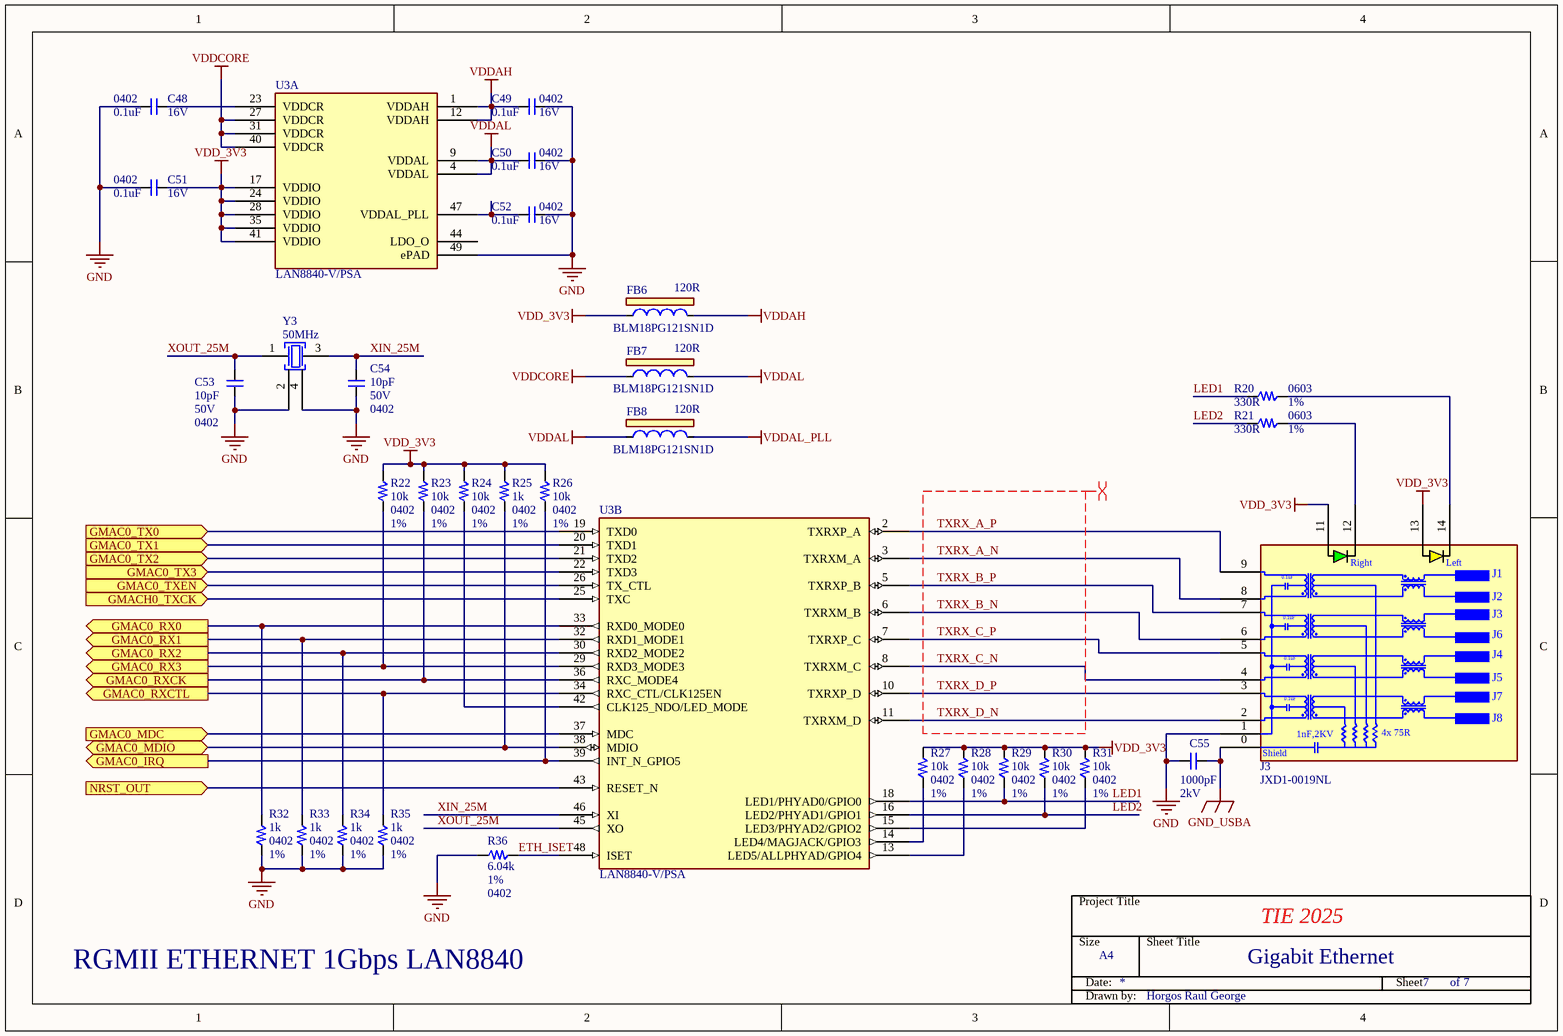
[diagram p6: Ethernet.SchDoc]

### Parts
C48  0.1uF  Rated Voltage: 16V  Package: 0402  [CAP0402]
C49  0.1uF  Rated Voltage: 16V  Package: 0402  [CAP0402]
C50  0.1uF  Rated Voltage: 16V  Package: 0402  [CAP0402]
C51  0.1uF  Rated Voltage: 16V  Package: 0402  [CAP0402]
C52  0.1uF  Rated Voltage: 16V  Package: 0402  [CAP0402]
C53  10pF  Rated Voltage: 50V  Package: 0402  [CAP0402]
C54  10pF  Rated Voltage: 50V  Package: 0402  [CAP0402]
C55  1000pF  Rated Voltage: 2kV  [CAP1206]
FB6  120R  [FB0603]
FB7  120R  [FB0603]
FB8  120R  [FB0603]
J3  JXD1-0019NL  [JXD1-0019NL]
R20  330R  Tolerance: 1%  Package: 0603  [RES0603]
R21  330R  Tolerance: 1%  Package: 0603  [RES0603]
R22  10k  Tolerance: 1%  Package: 0402  [RES0402]
R23  10k  Tolerance: 1%  Package: 0402  [RES0402]
R24  10k  Tolerance: 1%  Package: 0402  [RES0402]
R25  1k  Tolerance: 1%  Package: 0402  [RES0402]
R26  10k  Tolerance: 1%  Package: 0402  [RES0402]
R27  10k  Tolerance: 1%  Package: 0402  [RES0402]
R28  10k  Tolerance: 1%  Package: 0402  [RES0402]
R29  10k  Tolerance: 1%  Package: 0402  [RES0402]
R30  10k  Tolerance: 1%  Package: 0402  [RES0402]
R31  10k  Tolerance: 1%  Package: 0402  [RES0402]
R32  1k  Tolerance: 1%  Package: 0402  [RES0402]
R33  1k  Tolerance: 1%  Package: 0402  [RES0402]
R34  1k  Tolerance: 1%  Package: 0402  [RES0402]
R35  1k  Tolerance: 1%  Package: 0402  [RES0402]
R36  6.04k  Tolerance: 1%  Package: 0402  [RES0402]
Title_7  Title Block  (value not drawn)  (graphical)
U3  LAN8840-V/PSA  [QFN-48]  (parts A,B of 2)
Y3  50MHz  [VXM7-1362-50M0000000]

### Ports
GMAC0_IRQ (out, see MPU-PIO[4B]), GMAC0_MDC (in, see MPU-PIO[1B]), GMAC0_MDIO (bidir, see MPU-PIO[1B]), GMAC0_RX0 (out, see MPU-PIO[1B]), GMAC0_RX1 (out, see MPU-PIO[1B]), GMAC0_RX2 (out, see MPU-PIO[1B]), GMAC0_RX3 (out, see MPU-PIO[1B]), GMAC0_RXCK (out, see MPU-PIO[1B]), GMAC0_RXCTL (out, see MPU-PIO[1B]), GMAC0_TX0 (in, see MPU-PIO[1B]), GMAC0_TX1 (in, see MPU-PIO[1B]), GMAC0_TX2 (in, see MPU-PIO[1B]), GMAC0_TX3 (in, see MPU-PIO[1B]), GMAC0_TXEN (in, see MPU-PIO[1B]), GMACH0_TXCK (in, see MPU-PIO[1B]), NRST_OUT (in, see MPU-System[1A])

### Nets
GND: C48.1 C49.2 C50.2 C51.1 C52.2 C53.1 C54.2 C55.1 J3.1 R32.1 R33.1 R34.1 R35.1 R36.1 U3.49(ePAD) Y3.2 Y3.4
GND_USBA: C55.2 J3.0
VDD_3V3: C51.2 FB6.1 J3.11 J3.13 R22.2 R23.2 R24.2 R25.2 R26.2 R27.2 R28.2 R29.2 R30.2 R31.2 U3.17(VDDIO) U3.24(VDDIO) U3.28(VDDIO) U3.35(VDDIO) U3.41(VDDIO)
VDDAH: C49.1 FB6.2 U3.1(VDDAH) U3.12(VDDAH)
VDDAL: C50.1 FB7.2 FB8.1 U3.4(VDDAL) U3.9(VDDAL)
VDDAL_PLL: FB8.2
VDDCORE: FB7.1 U3.27(VDDCR) U3.31(VDDCR) U3.40(VDDCR)
ETH_ISET: R36.2 U3.48(ISET)
GMAC0_IRQ: R26.1 U3.39(INT_N_GPIO5) ; port GMAC0_IRQ
GMAC0_MDC: U3.37(MDC) ; port GMAC0_MDC
GMAC0_MDIO: R25.1 U3.38(MDIO) ; port GMAC0_MDIO
GMAC0_RX0: R32.2 U3.33(RXD0_MODE0) ; port GMAC0_RX0
GMAC0_RX1: R33.2 U3.32(RXD1_MODE1) ; port GMAC0_RX1
GMAC0_RX2: R34.2 U3.30(RXD2_MODE2) ; port GMAC0_RX2
GMAC0_RX3: R22.1 U3.29(RXD3_MODE3) ; port GMAC0_RX3
GMAC0_RXCK: R23.1 U3.36(RXC_MODE4) ; port GMAC0_RXCK
GMAC0_RXCTL: R35.2 U3.34(RXC_CTL/CLK125EN) ; port GMAC0_RXCTL
GMAC0_TX0: U3.19(TXD0) ; port GMAC0_TX0
GMAC0_TX1: U3.20(TXD1) ; port GMAC0_TX1
GMAC0_TX2: U3.21(TXD2) ; port GMAC0_TX2
GMAC0_TX3: U3.22(TXD3) ; port GMAC0_TX3
GMAC0_TXEN: U3.26(TX_CTL) ; port GMAC0_TXEN
GMACH0_TXCK: U3.25(TXC) ; port GMACH0_TXCK
LED1: R20.1 R29.1 U3.18(LED1/PHYAD0/GPIO0)
LED2: R21.1 R30.1 U3.16(LED2/PHYAD1/GPIO1)
NRST_OUT: U3.43(RESET_N) ; port NRST_OUT
TXRX_A_N: J3.8 U3.3(TXRXM_A)
TXRX_A_P: J3.9 U3.2(TXRXP_A)
TXRX_B_N: J3.6 U3.6(TXRXM_B)
TXRX_B_P: J3.7 U3.5(TXRXP_B)
TXRX_C_N: J3.4 U3.8(TXRXM_C)
TXRX_C_P: J3.5 U3.7(TXRXP_C)
TXRX_D_N: J3.2 U3.11(TXRXM_D)
TXRX_D_P: J3.3 U3.10(TXRXP_D)
XIN_25M: C54.1 U3.46(XI) Y3.3
XOUT_25M: C53.2 U3.45(XO) Y3.1
NetC48_2: C48.2 U3.23(VDDCR)
NetC52_1: C52.1 U3.47(VDDAL_PLL)
NetJ3_12: J3.12 R21.2
NetJ3_14: J3.14 R20.2
NetR24_1: R24.1 U3.42(CLK125_NDO/LED_MODE)
NetR27_1: R27.1 U3.14(LED4/MAGJACK/GPIO3)
NetR28_1: R28.1 U3.13(LED5/ALLPHYAD/GPIO4)
NetR31_1: R31.1 U3.15(LED3/PHYAD2/GPIO2)

Not connected (* = marked no-connect by the designer): U3 44(LDO_O)

### Layout directives
differential pair: TXRX_A_N, TXRX_A_P, TXRX_B_N, TXRX_B_P, TXRX_C_N, TXRX_C_P, TXRX_D_N, TXRX_D_P

### Notes on the sheet
- RGMII ETHERNET 1Gbps LAN8840
- Gigabit Ethernet
- (in symbol JXD1-0019NL) Right; Left; 0.1uF; J1; J2; J6; J4; J5; J7; J8; 1nF,2KV; 4x 75R; Shield
- (in symbol Title Block) Project Title; TIE 2025; Size; Sheet Title; A4; Date:; Sheet; of; Drawn by:; Horgos Raul George

### Library data of the parts
C48-C52 = C0402C104K4RAC7867: as C1 on sheet MPU-System; Manufacturer Part Number: C0402C104K4RAC7867; .Checked_SCH: AI; .Creator: AI
C53 C54 = QSCF500Q100J1GV001T: as C2 on sheet MPU-System; Manufacturer Part Number: QSCF500Q100J1GV001T; .Checked_SCH: AI; .Creator: AI
C55 = 202R18W102KV4E: CAP CER 1000pF 2KV 10% X7R SMD 1206; Manufacturer: D3_Johanson Dielectrics Inc; .Checked_PCB: AI; Manufacturer Part Number: 202R18W102KV4E; .Checked_SCH: AI; .Creator: AI
FB6-FB8 = BLM18PG121SN1D: as FB1 on sheet USB; .Checked_SCH: AI; .Creator: AI; Manufacturer Part Number: BLM18PG121SN1D
J3 = JXD1-0019NL: CON MODULAR JACK RJ45 10/100/1000 MAGNETICS 2xLEDs / SHIELD TH R/A; Manufacturer: Pulse Electronics; Manufacturer Part Number: JXD1-0019NL
R20 R21 = ERJ-3EKF3300V: RES TKF 330R 1% 1/10W SMD 0603; Manufacturer: Panasonic; .Checked_PCB: IC; Manufacturer Part Number: ERJ-3EKF3300V; .Checked_SCH: IC; .Creator: IC
R22-R24 R26-R31 = ERJ-2RKF1002X: as R1 on sheet MPU-System; Manufacturer Part Number: ERJ-2RKF1002X
R25 R32-R35 = ERJ-2RKF1001X: as R10 on sheet MPU-System; Manufacturer Part Number: ERJ-2RKF1001X
R36 = ERJ-2RKF6041X: RES TKF 6.04k 1% 1/10W SMD 0402 AEC-Q200; Manufacturer: Panasonic Electronic; Manufacturer Part Number: ERJ-2RKF6041X
U3 = LAN8840-V/PSA: MCHP INTERFACE ETHERNET LAN8840 QFN-48; Manufacturer: Microchip Technology; Manufacturer Part Number: LAN8840-V/PSA
Y3 = VXM7-1362-50M0000000: MCHP CRYSTAL 50MHz VXM7-1362-50M0000000 SMD / L3.2W2.5H0.8; Manufacturer: Microchip Technology; Manufacturer Part Number: VXM7-1362-50M0000000

## Nets that join several sheets
5V_MAIN: USB (6 pins), PMIC (9 pins)
DDR_VREF: MPU-System (C3.1 C7.2 R10.1 R11.2), MPU-Power (U1.E4 U1.R12)
GND: MPU-System (19 pins), MPU-Power (151 pins), USB (13 pins), PMIC (14 pins), SDCard-MIPI-User (19 pins), Ethernet (17 pins)
GND_USBA: USB (C34.2 FB2.1 J1.25), Ethernet (C55.2 J3.0)
VDD_2V5: MPU-System (C1.2 U1.D9), MPU-Power (8 pins)
VDD_3V3: MPU-System (R1.2), MPU-Power (28 pins), PMIC (5 pins), SDCard-MIPI-User (14 pins), Ethernet (19 pins)
VDDCORE: MPU-Power (24 pins), PMIC (C45.1 L3.2 U2.13), Ethernet (FB7.1 U3.27 U3.31 U3.40)
VDDIODDR: MPU-System (C3.2 C4.2 R10.2), MPU-Power (76 pins), PMIC (C43.1 L2.2 U2.6)
CAM_GPIO0: MPU-PIO (U1.T18), SDCard-MIPI-User (J5.11)
CAM_GPIO1: MPU-PIO (U1.R21), SDCard-MIPI-User (J5.12)
CAM_TWCK: MPU-PIO (U1.D11), SDCard-MIPI-User (J5.13 R43.2)
CAM_TWD: MPU-PIO (U1.A3), SDCard-MIPI-User (J5.14 R44.2)
DBGU_RX: MPU-PIO (U1.J20), SDCard-MIPI-User (J6.4)
DBGU_TX: MPU-PIO (U1.G25), SDCard-MIPI-User (J6.5)
GMAC0_IRQ: MPU-PIO (U1.F15), Ethernet (R26.1 U3.39)
GMAC0_MDC: MPU-PIO (U1.AA13), Ethernet (U3.37)
GMAC0_MDIO: MPU-PIO (U1.W15), Ethernet (R25.1 U3.38)
GMAC0_RX0: MPU-PIO (U1.U17), Ethernet (R32.2 U3.33)
GMAC0_RX1: MPU-PIO (U1.AA12), Ethernet (R33.2 U3.32)
GMAC0_RX2: MPU-PIO (U1.T17), Ethernet (R34.2 U3.30)
GMAC0_RX3: MPU-PIO (U1.AA16), Ethernet (R22.1 U3.29)
GMAC0_RXCK: MPU-PIO (U1.Y14), Ethernet (R23.1 U3.36)
GMAC0_RXCTL: MPU-PIO (U1.Y13), Ethernet (R35.2 U3.34)
GMAC0_TX0: MPU-PIO (U1.Y15), Ethernet (U3.19)
GMAC0_TX1: MPU-PIO (U1.W13), Ethernet (U3.20)
GMAC0_TX2: MPU-PIO (U1.AA14), Ethernet (U3.21)
GMAC0_TX3: MPU-PIO (U1.AA15), Ethernet (U3.22)
GMAC0_TXEN: MPU-PIO (U1.V15), Ethernet (U3.26)
GMACH0_TXCK: MPU-PIO (U1.Y17), Ethernet (U3.25)
LED_BLUE: MPU-PIO (U1.W24), SDCard-MIPI-User (R45.1)
LED_GREEN: MPU-PIO (U1.J23), SDCard-MIPI-User (R46.1)
LED_RED: MPU-PIO (U1.K19), SDCard-MIPI-User (R47.1)
LPM: MPU-System (U1.P15), PMIC (U2.4)
MIPI_CK_N: MPU-System (U1.Y21), SDCard-MIPI-User (J5.8)
MIPI_CK_P: MPU-System (U1.AA21), SDCard-MIPI-User (J5.9)
MIPI_D0_N: MPU-System (U1.Y22), SDCard-MIPI-User (J5.2)
MIPI_D0_P: MPU-System (U1.AA22), SDCard-MIPI-User (J5.3)
MIPI_D1_N: MPU-System (U1.Y20), SDCard-MIPI-User (J5.5)
MIPI_D1_P: MPU-System (U1.AA20), SDCard-MIPI-User (J5.6)
NRST: MPU-System (U1.G13), PMIC (R17.1 U2.2), SDCard-MIPI-User (C59.2 SW2.3 SW2.4)
NRST_OUT: MPU-System (R1.1 U1.B9), Ethernet (U3.43)
nSTART: PMIC (U2.14), SDCard-MIPI-User (C58.2 SW1.3 SW1.4)
SDMMC1_CD: MPU-PIO (U1.H11), SDCard-MIPI-User (J4.G4 R42.1)
SDMMC1_CK: MPU-PIO (U1.A16), SDCard-MIPI-User (J4.P5)
SDMMC1_CMD: MPU-PIO (U1.A19), SDCard-MIPI-User (J4.P3 R41.1)
SDMMC1_DAT0: MPU-PIO (U1.B19), SDCard-MIPI-User (J4.P7 R37.1)
SDMMC1_DAT1: MPU-PIO (U1.A18), SDCard-MIPI-User (J4.P8 R38.1)
SDMMC1_DAT2: MPU-PIO (U1.A17), SDCard-MIPI-User (J4.P1 R39.1)
SDMMC1_DAT3: MPU-PIO (U1.B17), SDCard-MIPI-User (J4.P2 R40.1)
SHDN: MPU-System (U1.R15), PMIC (U2.3)
USBA_CC1: MPU-System (U1.C13), USB (C32.2 J1.A5)
USBA_CC2: MPU-System (U1.D15), USB (C33.2 J1.B5)
USBA_N: MPU-System (U1.B11), USB (J1.A7 J1.B7)
USBA_P: MPU-System (U1.A11), USB (J1.A6 J1.B6)
USBB_N: MPU-System (U1.B13), USB (J2.2)
USBB_P: MPU-System (U1.A13), USB (J2.3)
WKUP: MPU-System (U1.Y11), PMIC (R16.1 U2.5)

## Assembly variants
SE_Variant: not fitted C1